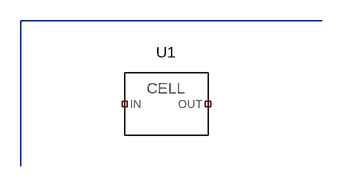
[diagram p0: schematic symbol_text.asc]
symbol_text.asc, the LTspice schematic file:
Version 4
SHEET 1 560 280
WIRE -32 -64 432 -64
WIRE -32 -64 -32 160
SYMBOL labelled_cell 192 64 R0
SYMATTR InstName U1

The netlist it stands for:
* symbol_text.asc
XU1 NC_01 NC_02 labelled_cell  ; pins IN OUT
.backanno
.end